# Altium project 24V-70A-Power-Board-v2.0.PrjPcb (part 1 of 8)
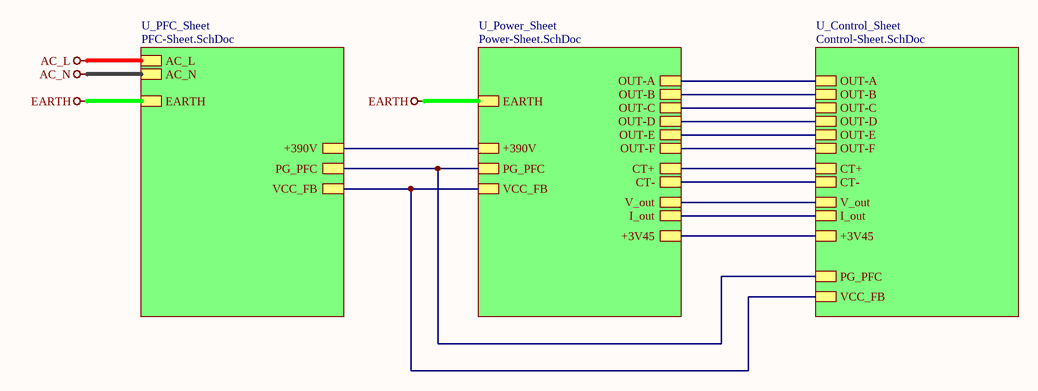
[diagram p0: Top-Sheet.SchDoc]
4 sheets, 330 parts. Net scope: hierarchical (ports join the sheet entries above them; power ports are global).
Board file: 24V-70A-Power-Board-v2.0.PcbDoc
Sheets:
  Top-Sheet.SchDoc
    U_Power_Sheet = Power-Sheet.SchDoc
    U_PFC_Sheet = PFC-Sheet.SchDoc
    U_Control_Sheet = Control-Sheet.SchDoc

## Sheet Top-Sheet.SchDoc
size A4; SheetNumber: 1; SheetTotal: 4

### Sub-sheets
U_Control_Sheet = Control-Sheet.SchDoc: CT+, CT-, OUT-A, OUT-B, OUT-C, OUT-D, OUT-E, OUT-F, V_out, I_out, +3V45, PG_PFC, VCC_FB
U_PFC_Sheet = PFC-Sheet.SchDoc: AC_L, EARTH, AC_N, +390V, PG_PFC, VCC_FB
U_Power_Sheet = Power-Sheet.SchDoc: OUT-A, OUT-B, PG_PFC, VCC_FB, OUT-C, EARTH, +390V, OUT-D, OUT-E, OUT-F, CT+, CT-, V_out, I_out, +3V45

### Nets
EARTH: sheet U_Power_Sheet/EARTH, sheet U_PFC_Sheet/EARTH
+3V45: sheet U_Power_Sheet/+3V45, sheet U_Control_Sheet/+3V45
+390V: sheet U_Power_Sheet/+390V, sheet U_PFC_Sheet/+390V
CT+: sheet U_Power_Sheet/CT+, sheet U_Control_Sheet/CT+
CT-: sheet U_Power_Sheet/CT-, sheet U_Control_Sheet/CT-
I_out: sheet U_Power_Sheet/I_out, sheet U_Control_Sheet/I_out
OUT-A: sheet U_Power_Sheet/OUT-A, sheet U_Control_Sheet/OUT-A
OUT-B: sheet U_Power_Sheet/OUT-B, sheet U_Control_Sheet/OUT-B
OUT-C: sheet U_Power_Sheet/OUT-C, sheet U_Control_Sheet/OUT-C
OUT-D: sheet U_Power_Sheet/OUT-D, sheet U_Control_Sheet/OUT-D
OUT-E: sheet U_Power_Sheet/OUT-E, sheet U_Control_Sheet/OUT-E
OUT-F: sheet U_Power_Sheet/OUT-F, sheet U_Control_Sheet/OUT-F
PG_PFC: sheet U_Power_Sheet/PG_PFC, sheet U_PFC_Sheet/PG_PFC, sheet U_Control_Sheet/PG_PFC
V_out: sheet U_Power_Sheet/V_out, sheet U_Control_Sheet/V_out
VCC_FB: sheet U_Power_Sheet/VCC_FB, sheet U_PFC_Sheet/VCC_FB, sheet U_Control_Sheet/VCC_FB

### Notes on the sheet
- File:
- Title:
- Date:
- Page
- Num:
- Total:
- Drawn By: Huzaifa Ali

## Sheet Power-Sheet.SchDoc
size 420 x 297 mm; SheetNumber: 3; SheetTotal: 4
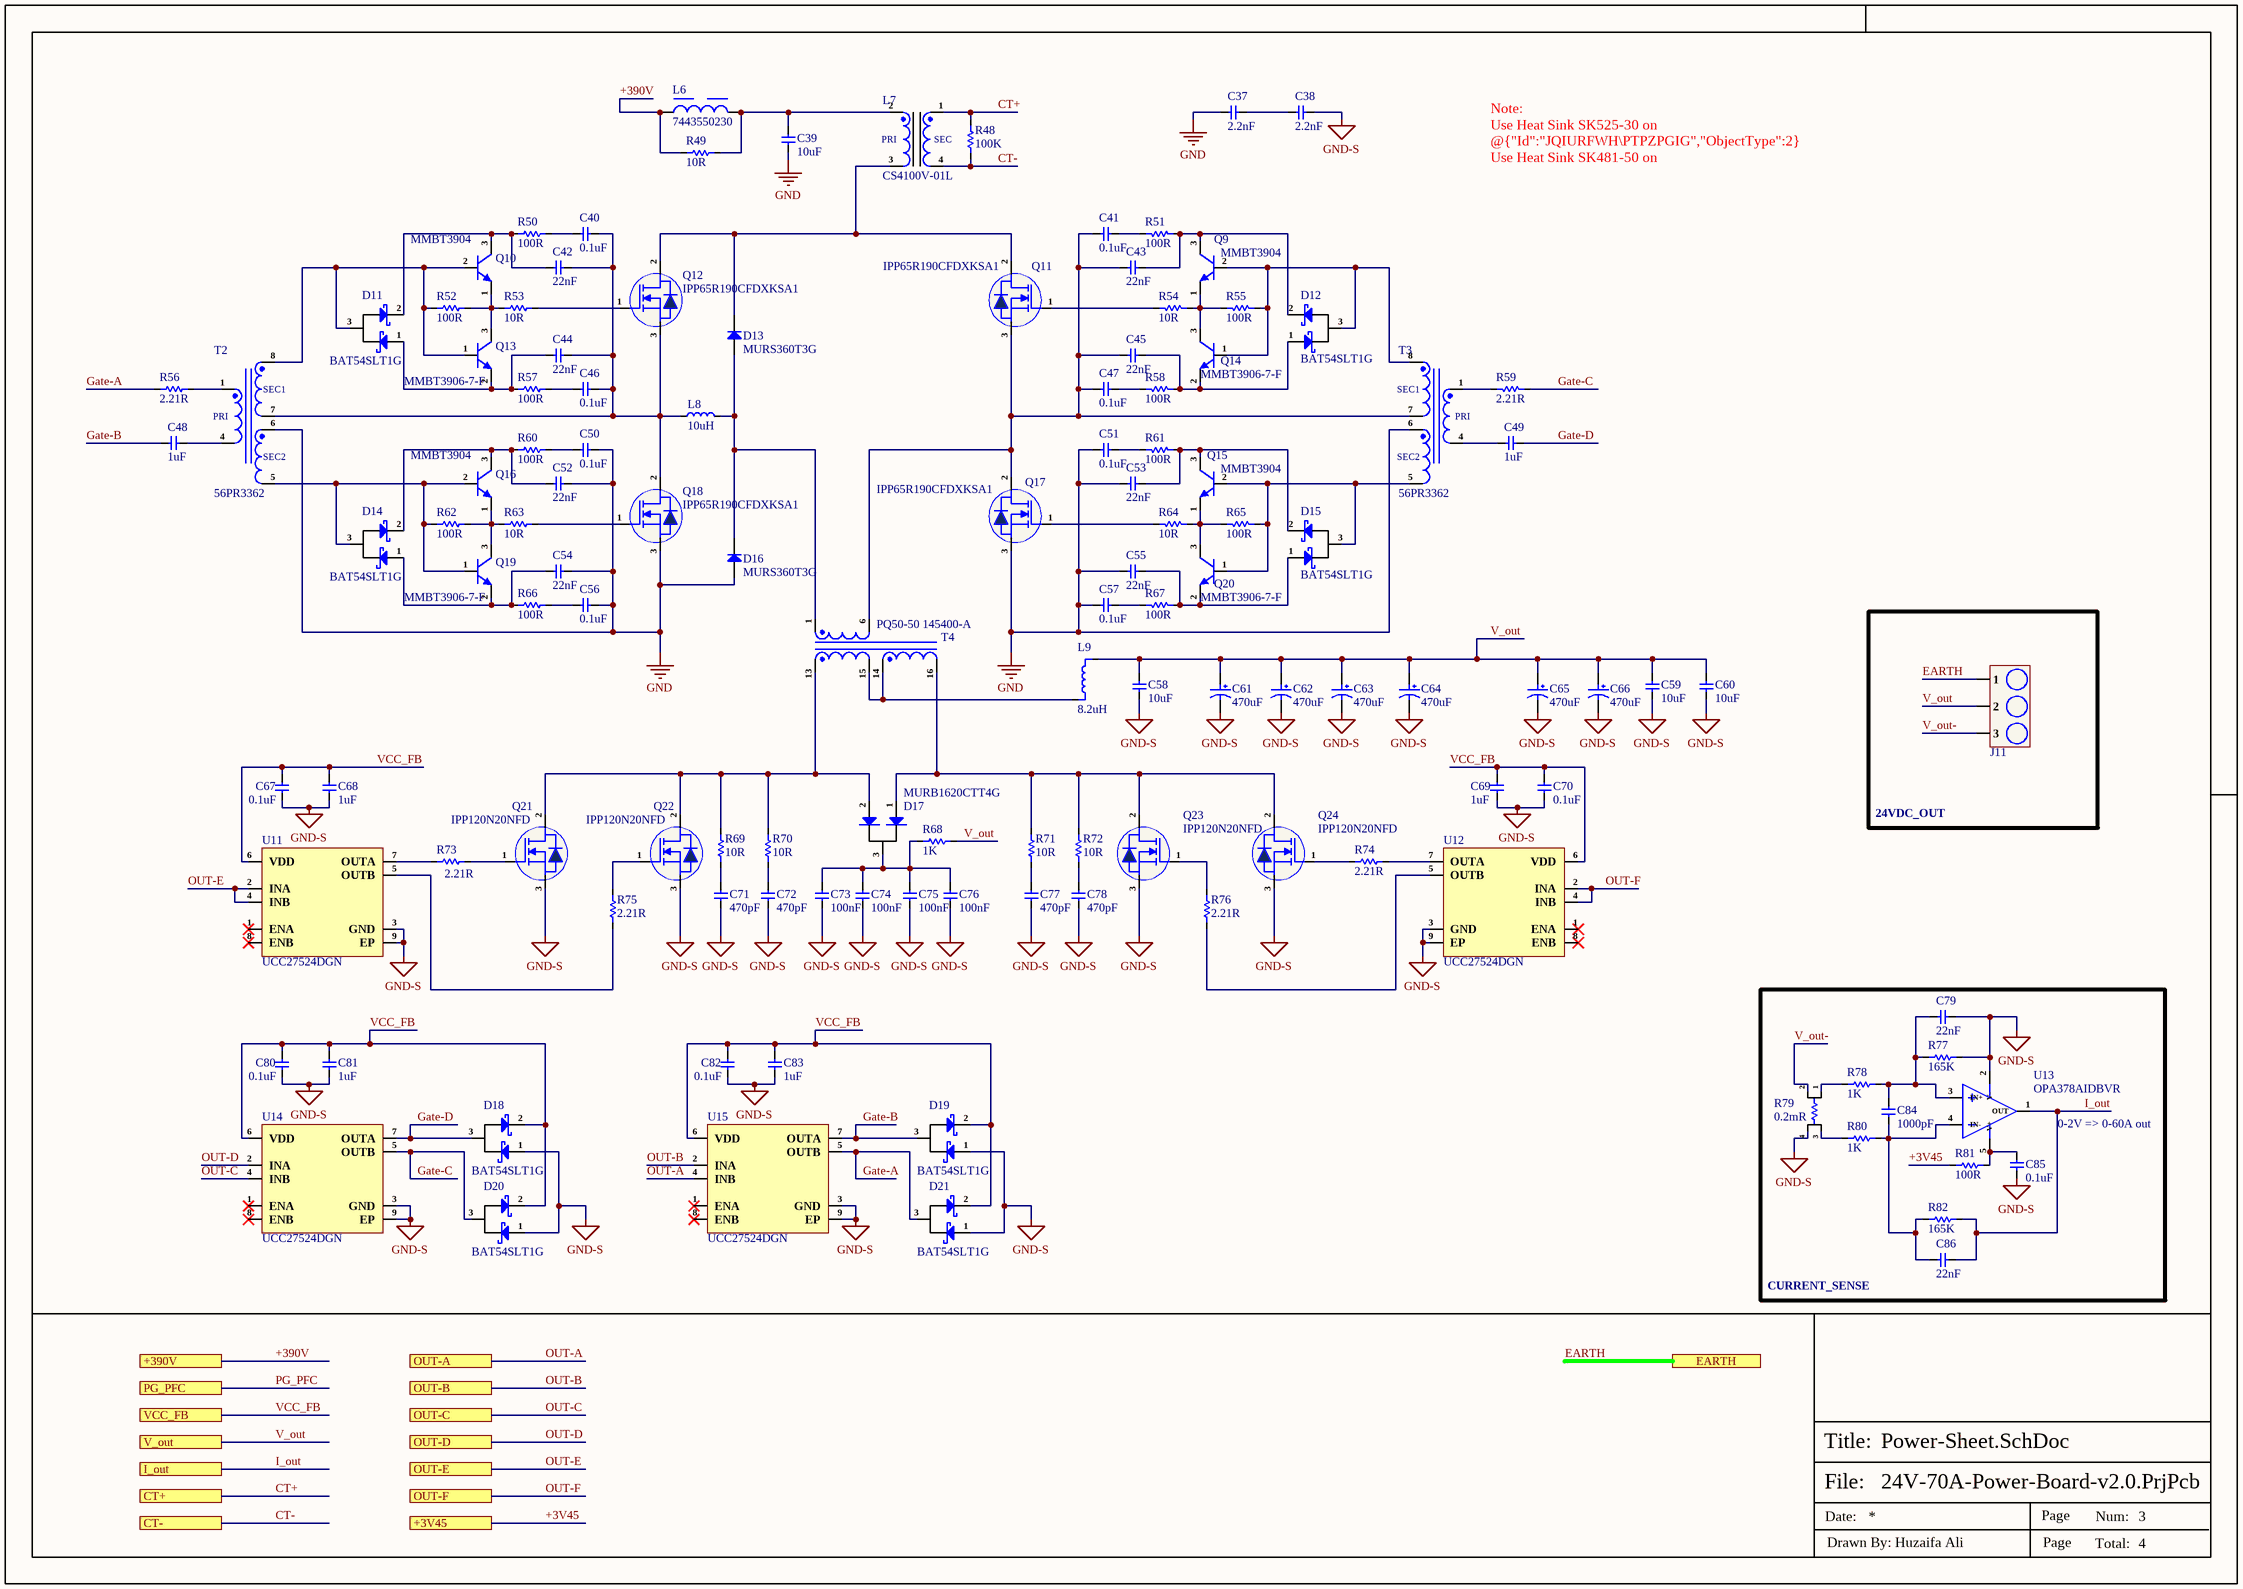
[diagram p1: Power-Sheet.SchDoc]

### Parts
C37  2.2nF  [DE1E3RA222MN4AP01F]
C38  2.2nF  [DE1E3RA222MN4AP01F]
C39  10uF  [B32774X5106K000]
C40  0.1uF  [Cap-0603]
C41  0.1uF  [Cap-0603]
C42  22nF  [Cap-0603]
C43  22nF  [Cap-0603]
C44  22nF  [Cap-0603]
C45  22nF  [Cap-0603]
C46  0.1uF  [Cap-0603]
C47  0.1uF  [Cap-0603]
C48  1uF  [Cap-0603]
C49  1uF  [Cap-0603]
C50  0.1uF  [Cap-0603]
C51  0.1uF  [Cap-0603]
C52  22nF  [Cap-0603]
C53  22nF  [Cap-0603]
C54  22nF  [Cap-0603]
C55  22nF  [Cap-0603]
C56  0.1uF  [Cap-0603]
C57  0.1uF  [Cap-0603]
C58  10uF  [Cap-1210]
C59  10uF  [Cap-1210]
C60  10uF  [Cap-1210]
C61  470uF  [EKZM500ELL471MK20S]
C62  470uF  [EKZM500ELL471MK20S]
C63  470uF  [EKZM500ELL471MK20S]
C64  470uF  [EKZM500ELL471MK20S]
C65  470uF  [EKZM500ELL471MK20S]
C66  470uF  [EKZM500ELL471MK20S]
C67  0.1uF  [Cap-0603]
C68  1uF  [Cap-0603]
C69  1uF  [Cap-0603]
C70  0.1uF  [Cap-0603]
C71  470pF  [Cap-1206]
C72  470pF  [Cap-1206]
C73  100nF  [Cap-1206]
C74  100nF  [Cap-1206]
C75  100nF  [Cap-1206]
C76  100nF  [Cap-1206]
C77  470pF  [Cap-1206]
C78  470pF  [Cap-1206]
C79  22nF  [Cap-0603]
C80  0.1uF  [Cap-0603]
C81  1uF  [Cap-0603]
C82  0.1uF  [Cap-0603]
C83  1uF  [Cap-0603]
C84  1000pF  [Cap-0603]
C85  0.1uF  [Cap-0603]
C86  22nF  [Cap-0603]
D11  BAT54SLT1G  [SOT-23]
D12  BAT54SLT1G  [SOT-23]
D13  MURS360T3G  [SMC]
D14  BAT54SLT1G  [SOT-23]
D15  BAT54SLT1G  [SOT-23]
D16  MURS360T3G  [SMC]
D17  MURB1620CTT4G  [D2Pak.]
D18  BAT54SLT1G  [SOT-23]
D19  BAT54SLT1G  [SOT-23]
D20  BAT54SLT1G  [SOT-23]
D21  BAT54SLT1G  [SOT-23]
J11  KF88SM-16.0-3P  [KF88SM-16.0-3P]  (value not drawn)
L6  7443550230  [7443550230]
L7  CS4100V-01L  [CS4100V-01L]
L8  10uH  [CSBL1809-100M]
L9  8.2uH  [CPRX3231L-8R2MC]
Q9  MMBT3904  [SOT-23]
Q10  MMBT3904  [SOT-23]
Q11  IPP65R190CFDXKSA1  [TO-220-3]
Q12  IPP65R190CFDXKSA1  [TO-220-3]
Q13  MMBT3906-7-F  [SOT-23]
Q14  MMBT3906-7-F  [SOT-23]
Q15  MMBT3904  [SOT-23]
Q16  MMBT3904  [SOT-23]
Q17  IPP65R190CFDXKSA1  [TO-220-3]
Q18  IPP65R190CFDXKSA1  [TO-220-3]
Q19  MMBT3906-7-F  [SOT-23]
Q20  MMBT3906-7-F  [SOT-23]
Q21  IPP120N20NFD  [TO-220-3]
Q22  IPP120N20NFD  [TO-220-3]
Q23  IPP120N20NFD  [TO-220-3]
Q24  IPP120N20NFD  [TO-220-3]
R48  100K  [RES-0805]
R49  10R  [RES-2010]
R50  100R  [Res-0603]
R51  100R  [Res-0603]
R52  100R  [Res-0603]
R53  10R  [Res-1206]
R54  10R  [Res-1206]
R55  100R  [Res-0603]
R56  2.21R  [Res-1206]
R57  100R  [Res-0603]
R58  100R  [Res-0603]
R59  2.21R  [Res-1206]
R60  100R  [Res-0603]
R61  100R  [Res-0603]
R62  100R  [Res-0603]
R63  10R  [Res-1206]
R64  10R  [Res-1206]
R65  100R  [Res-0603]
R66  100R  [Res-0603]
R67  100R  [Res-0603]
R68  1K  [TO-220-2]
R69  10R  [RES-2010]
R70  10R  [RES-2010]
R71  10R  [RES-2010]
R72  10R  [RES-2010]
R73  2.21R  [Res-1206]
R74  2.21R  [Res-1206]
R75  2.21R  [Res-1206]
R76  2.21R  [Res-1206]
R77  165K  [Res-0603]
R78  1K  [Res-0603]
R79  0.2mR  [BVR-Z-R0002-1.0]
R80  1K  [Res-0603]
R81  100R  [Res-0603]
R82  165K  [Res-0603]
T2  56PR3362  [56PR3362]
T3  56PR3362  [56PR3362]
T4  PQ50-50 145400-A  [PQ50-50 145400-A]
U11  UCC27524DGN  [8-HVSSOP]
U12  UCC27524DGN  [8-HVSSOP]
U13  OPA378AIDBVR  [SOT-23-5]
U14  UCC27524DGN  [8-HVSSOP]
U15  UCC27524DGN  [8-HVSSOP]

### Blocks framed on the sheet
24VDC_OUT: J11

### Ports
+3V45 (see Top-Sheet[3C], Control-Sheet[1D]), +390V (see Top-Sheet[2B], PFC-Sheet[1D]), CT+ (see Top-Sheet[3B], Control-Sheet[1D]), CT- (see Top-Sheet[3B], Control-Sheet[1D]), EARTH (see Top-Sheet[2B], PFC-Sheet[5D]), I_out (see Top-Sheet[3C], Control-Sheet[1D]), OUT-A (see Top-Sheet[3B], Control-Sheet[2D]), OUT-B (see Top-Sheet[3B], Control-Sheet[2D]), OUT-C (see Top-Sheet[3B], Control-Sheet[2D]), OUT-D (see Top-Sheet[3B], Control-Sheet[2D]), OUT-E (see Top-Sheet[3B], Control-Sheet[2D]), OUT-F (see Top-Sheet[3B], Control-Sheet[2D]), PG_PFC (see Top-Sheet[2B], Control-Sheet[1D], PFC-Sheet[1D]), V_out (see Top-Sheet[3B], Control-Sheet[1D]), VCC_FB (see Top-Sheet[2B], Control-Sheet[1D], PFC-Sheet[1D])

### Nets
EARTH: J11.1 ; port EARTH
GND: C37.1 C39.1 C50.2 C51.2 C52.2 C53.2 C54.2 C55.2 C56.2 C57.2 D16.2(A) Q17.3(S) Q18.3(S) T2.6 T3.6
GND-S: C38.2 C58.1 C59.1 C60.1 C61.2 C62.2 C63.2 C64.2 C65.2 C66.2 C67.1 C68.1 C69.1 C70.1 C71.1 C72.1 C73.1 C74.1 C75.1 C76.1 C77.1 C78.1 C79.1 C80.1 C81.1 C82.1 C83.1 C85.2 D18.1(A) D19.1(A) D20.1(A) D21.1(A) Q21.3(S) Q22.3(S) Q23.3(S) Q24.3(S) R77.2 R79.4 U11.3(GND) U11.9(EP) U12.3(GND) U12.9(EP) U13.2(V-) U14.3(GND) U14.9(EP) U15.3(GND) U15.9(EP)
+3V45: R81.1 ; port +3V45
+390V: L6.1 R49.1 ; port +390V
CT+: L7.1 R48.2 ; port CT+
CT-: L7.4 R48.1 ; port CT-
Gate-A: D21.3(A/K) R56.1 U15.5(OUTB)
Gate-B: C48.1 D19.3(A/K) U15.7(OUTA)
Gate-C: D20.3(A/K) R59.1 U14.5(OUTB)
Gate-D: C49.1 D18.3(A/K) U14.7(OUTA)
I_out: C86.1 R82.2 U13.1(OUT) ; port I_out
OUT-A: U15.4(INB) ; port OUT-A
OUT-B: U15.2(INA) ; port OUT-B
OUT-C: U14.4(INB) ; port OUT-C
OUT-D: U14.2(INA) ; port OUT-D
OUT-E: U11.2(INA) U11.4(INB) ; port OUT-E
OUT-F: U12.2(INA) U12.4(INB) ; port OUT-F
V_out: C58.2 C59.2 C60.2 C61.1 C62.1 C63.1 C64.1 C65.1 C66.1 J11.2 L9.2 R68.2 ; port V_out
V_out-: J11.3 R79.2
VCC_FB: C67.2 C68.2 C69.2 C70.2 C80.2 C81.2 C82.2 C83.2 D18.2(K) D19.2(K) D20.2(K) D21.2(K) U11.6(VDD) U12.6(VDD) U14.6(VDD) U15.6(VDD) ; port VCC_FB
NetC37_2: C37.2 C38.1
NetC39_2: C39.2 L6.2 L7.2 R49.2
NetC40_1: C40.1 R50.2
NetC40_2: C40.2 C42.2 C44.2 C46.2 L8.1 Q12.3(S) Q18.2(D) T2.7
NetC41_1: C41.1 R51.2
NetC41_2: C41.2 C43.2 C45.2 C47.2 Q11.3(S) Q17.2(D) T3.7 T4.6
NetC42_1: C42.1 D11.2(K) Q10.3(C) R50.1
NetC43_1: C43.1 D12.2(K) Q9.3(C) R51.1
NetC44_1: C44.1 D11.1(A) Q13.2(E) R57.1
NetC45_1: C45.1 D12.1(A) Q14.2(E) R58.1
NetC46_1: C46.1 R57.2
NetC47_1: C47.1 R58.2
NetC48_2: C48.2 T2.4
NetC49_2: C49.2 T3.4
NetC50_1: C50.1 R60.2
NetC51_1: C51.1 R61.2
NetC52_1: C52.1 D14.2(K) Q16.3(C) R60.1
NetC53_1: C53.1 D15.2(K) Q15.3(C) R61.1
NetC54_1: C54.1 D14.1(A) Q19.2(E) R66.1
NetC55_1: C55.1 D15.1(A) Q20.2(E) R67.1
NetC56_1: C56.1 R66.2
NetC57_1: C57.1 R67.2
NetC71_2: C71.2 R69.1
NetC72_2: C72.2 R70.1
NetC73_2: C73.2 C74.2 C75.2 C76.2 D17.3(K) R68.1
NetC77_2: C77.2 R71.1
NetC78_2: C78.2 R72.1
NetC79_2: C79.2 C84.2 R77.1 R78.2 U13.3(IN+)
NetC84_1: C84.1 C86.2 R80.2 R82.1 U13.4(IN-)
NetC85_1: C85.1 R81.2 U13.5(V+)
NetD11_3: D11.3(A/K) Q10.2(B) Q13.1(B) R52.1 T2.8
NetD12_3: D12.3(A/K) Q9.2(B) Q14.1(B) R55.1 T3.8
NetD13_1: D13.1(K) L7.3 Q11.2(D) Q12.2(D)
NetD13_2: D13.2(A) D16.1(K) L8.2 T4.1
NetD14_3: D14.3(A/K) Q16.2(B) Q19.1(B) R62.1 T2.5
NetD15_3: D15.3(A/K) Q15.2(B) Q20.1(B) R65.1 T3.5
NetD17_1: D17.1(A) Q23.2(D) Q24.2(D) R71.2 R72.2 T4.16
NetD17_2: D17.2(A) Q21.2(D) Q22.2(D) R69.2 R70.2 T4.13
NetL9_1: L9.1 T4.14 T4.15
NetQ9_1: Q9.1(E) Q14.3(C) R54.1 R55.2
NetQ10_1: Q10.1(E) Q13.3(C) R52.2 R53.1
NetQ11_1: Q11.1(G) R54.2
NetQ12_1: Q12.1(G) R53.2
NetQ15_1: Q15.1(E) Q20.3(C) R64.1 R65.2
NetQ16_1: Q16.1(E) Q19.3(C) R62.2 R63.1
NetQ17_1: Q17.1(G) R64.2
NetQ18_1: Q18.1(G) R63.2
NetQ21_1: Q21.1(G) R73.2
NetQ22_1: Q22.1(G) R75.2
NetQ23_1: Q23.1(G) R76.2
NetQ24_1: Q24.1(G) R74.1
NetR56_2: R56.2 T2.1
NetR59_2: R59.2 T3.1
NetR73_1: R73.1 U11.7(OUTA)
NetR74_2: R74.2 U12.7(OUTA)
NetR75_1: R75.1 U11.5(OUTB)
NetR76_1: R76.1 U12.5(OUTB)
NetR78_1: R78.1 R79.1
NetR79_3: R79.3 R80.1

Not connected (* = marked no-connect by the designer): U11 1(ENA)* 8(ENB)*; U12 1(ENA)* 8(ENB)*; U14 1(ENA)* 8(ENB)*; U15 1(ENA)* 8(ENB)*

### Notes on the sheet
- Note:
  Use Heat Sink SK525-30 on @{"Id":"JQIURFWH\PTPZPGIG","ObjectType":2}
  Use Heat Sink SK481-50 on @{"Id":"JQIURFWH\ZDXJWPHV","ObjectType":2} @{"Id":"JQIURFWH\OICRCLGX","ObjectType":2}
  Use Heat Sink SK481-50 on @{"Id":"JQIURFWH\XJUUDAXH","ObjectType":2} @{"Id":"JQIURFWH\AKDYJAPY","ObjectType":2}
  Use Heat Sink SK481-50 on @{"Id":"JQIURFWH\ISULFHIE","ObjectType":2} @{"Id":"JQIURFWH\ARVZWMFG","ObjectType":2}
  Use Heat Sink SK481-50 on @{"Id":"JQIURFWH\MSXFWYQL","ObjectType":2} @{"Id":"JQIURFWH\PXEOWEUF","ObjectType":2}
- 0-2V => 0-60A out
- CURRENT_SENSE
- File:
- Title:
- Date:
- Page
- Num:
- Total:
- Drawn By: Huzaifa Ali